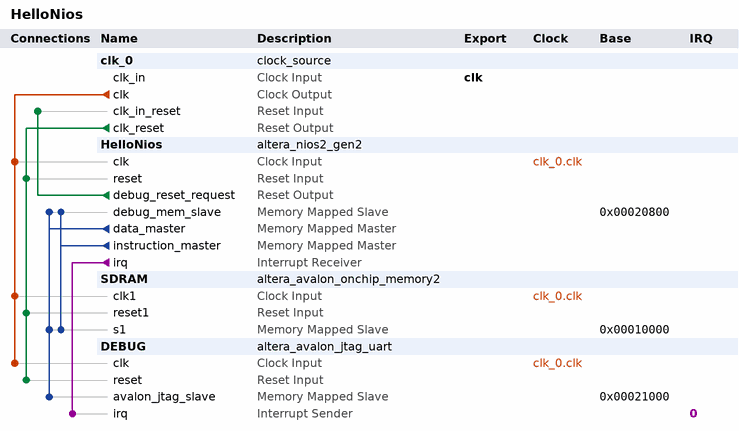
[diagram p0: system contents]
# Platform Designer (Qsys) system HelloNios, Cyclone V 5CSEMA5F31C6
# Parameters at their usual value, and those the tool derives, are not listed.
package require -exact qsys 18.1
create_system HelloNios
set_project_property DEVICE_FAMILY {Cyclone V}
set_project_property DEVICE 5CSEMA5F31C6

add_instance clk_0 clock_source 18.1
set_instance_parameter_value clk_0 clockFrequency 50000000

add_instance HelloNios altera_nios2_gen2 18.1
set_instance_parameter_value HelloNios dcache_size 2048
set_instance_parameter_value HelloNios exceptionSlave SDRAM.s1
set_instance_parameter_value HelloNios icache_size 4096
set_instance_parameter_value HelloNios impl Tiny
set_instance_parameter_value HelloNios resetSlave SDRAM.s1

add_instance SDRAM altera_avalon_onchip_memory2 18.1
set_instance_parameter_value SDRAM dataWidth 32
set_instance_parameter_value SDRAM dualPort false
set_instance_parameter_value SDRAM initMemContent true
set_instance_parameter_value SDRAM initializationFileName onchip_mem.hex
set_instance_parameter_value SDRAM memorySize 40960

add_instance DEBUG altera_avalon_jtag_uart 18.1
set_instance_parameter_value DEBUG simInteractiveOptions NO_INTERACTIVE_WINDOWS

# connections
add_connection clk_0.clk DEBUG.clk clock
add_connection clk_0.clk HelloNios.clk clock
add_connection clk_0.clk SDRAM.clk1 clock
add_connection clk_0.clk_reset DEBUG.reset reset
add_connection clk_0.clk_reset HelloNios.reset reset
add_connection clk_0.clk_reset SDRAM.reset1 reset
add_connection HelloNios.debug_reset_request clk_0.clk_in_reset reset
add_connection HelloNios.data_master DEBUG.avalon_jtag_slave avalon
set_connection_parameter_value HelloNios.data_master/DEBUG.avalon_jtag_slave baseAddress 0x00021000
add_connection HelloNios.data_master HelloNios.debug_mem_slave avalon
set_connection_parameter_value HelloNios.data_master/HelloNios.debug_mem_slave baseAddress 0x00020800
add_connection HelloNios.data_master SDRAM.s1 avalon
set_connection_parameter_value HelloNios.data_master/SDRAM.s1 baseAddress 0x00010000
add_connection HelloNios.instruction_master HelloNios.debug_mem_slave avalon
set_connection_parameter_value HelloNios.instruction_master/HelloNios.debug_mem_slave baseAddress 0x00020800
add_connection HelloNios.instruction_master SDRAM.s1 avalon
set_connection_parameter_value HelloNios.instruction_master/SDRAM.s1 baseAddress 0x00010000
add_connection HelloNios.irq DEBUG.irq interrupt
set_connection_parameter_value HelloNios.irq/DEBUG.irq irqNumber 0

# exported interfaces
add_interface clk clock sink
set_interface_property clk EXPORT_OF clk_0.clk_in

set_interconnect_requirement {$system} qsys_mm.clockCrossingAdapter HANDSHAKE
set_interconnect_requirement {$system} qsys_mm.enableEccProtection FALSE
set_interconnect_requirement {$system} qsys_mm.insertDefaultSlave FALSE
set_interconnect_requirement {$system} qsys_mm.maxAdditionalLatency 1

save_system HelloNios.qsys
